# Altium schematic sheet Switch.SchDoc
size A; SheetNumber: 7; SheetTotal: 12
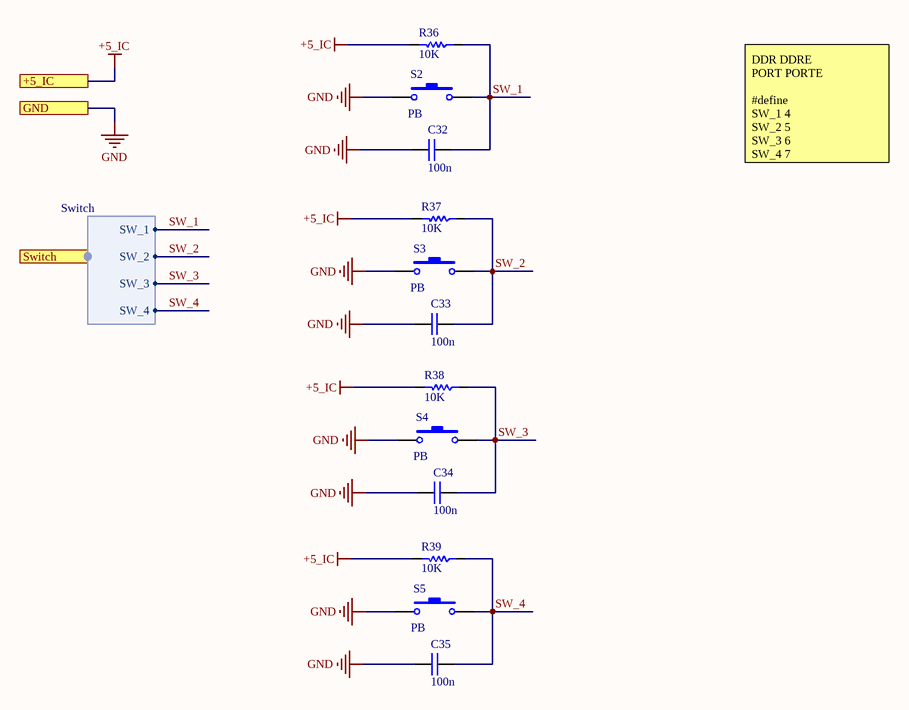
[diagram p0: Switch.SchDoc]

## Parts
C32  100n  [CAP 1206/3216]
C33  100n  [CAP 1206/3216]
C34  100n  [CAP 1206/3216]
C35  100n  [CAP 1206/3216]
R36  10K  [RES 1206 (3216X08L)]
R37  10K  [RES 1206 (3216X08L)]
R38  10K  [RES 1206 (3216X08L)]
R39  10K  [RES 1206 (3216X08L)]
S2  PB  [SW_PB_SMD_2PIN_SPST_6X3X2]
S3  PB  [SW_PB_SMD_2PIN_SPST_6X3X2]
S4  PB  [SW_PB_SMD_2PIN_SPST_6X3X2]
S5  PB  [SW_PB_SMD_2PIN_SPST_6X3X2]

## Ports
+5_IC, GND, Switch (harness Switch)

## Harnesses
Switch: SW_1, SW_2, SW_3, SW_4

## Nets
+5_IC: R36.2 R37.2 R38.2 R39.2 ; port +5_IC
GND: C32.2 C33.2 C34.2 C35.2 S2.1 S3.1 S4.1 S5.1 ; port GND
SW_1: C32.1 R36.1 S2.2 ; port Switch.SW_1
SW_2: C33.1 R37.1 S3.2 ; port Switch.SW_2
SW_3: C34.1 R38.1 S4.2 ; port Switch.SW_3
SW_4: C35.1 R39.1 S5.2 ; port Switch.SW_4

## Notes on the sheet
- DDR DDRE
  PORT PORTE
  #define
  SW_1 4
  SW_2 5
  SW_3 6
  SW_4 7

## Library data of the parts
C32-C35 = Cap_Multi_SMD_100nF_1206: Bipolar ceramic capacitor SMD; Type: MultiLayer; Inflow: inflow?; Rating: 50V; Validation: Valid; Package: 1206; Value: 100n
R36-R39 = Res_SMD_1206: Resistor; Inflow: inflow?; Rating: 0.25W; Validation: Valid; Package: 1206; Type: 10%; Value: 10K
S2-S5 = SW_PushButton_2_SMD: SMT Tactile ‎Switch; Rating: 2b; Validation: Valid; Inflow: 8260; Type: Vertical; Package: SMD; Value: PB